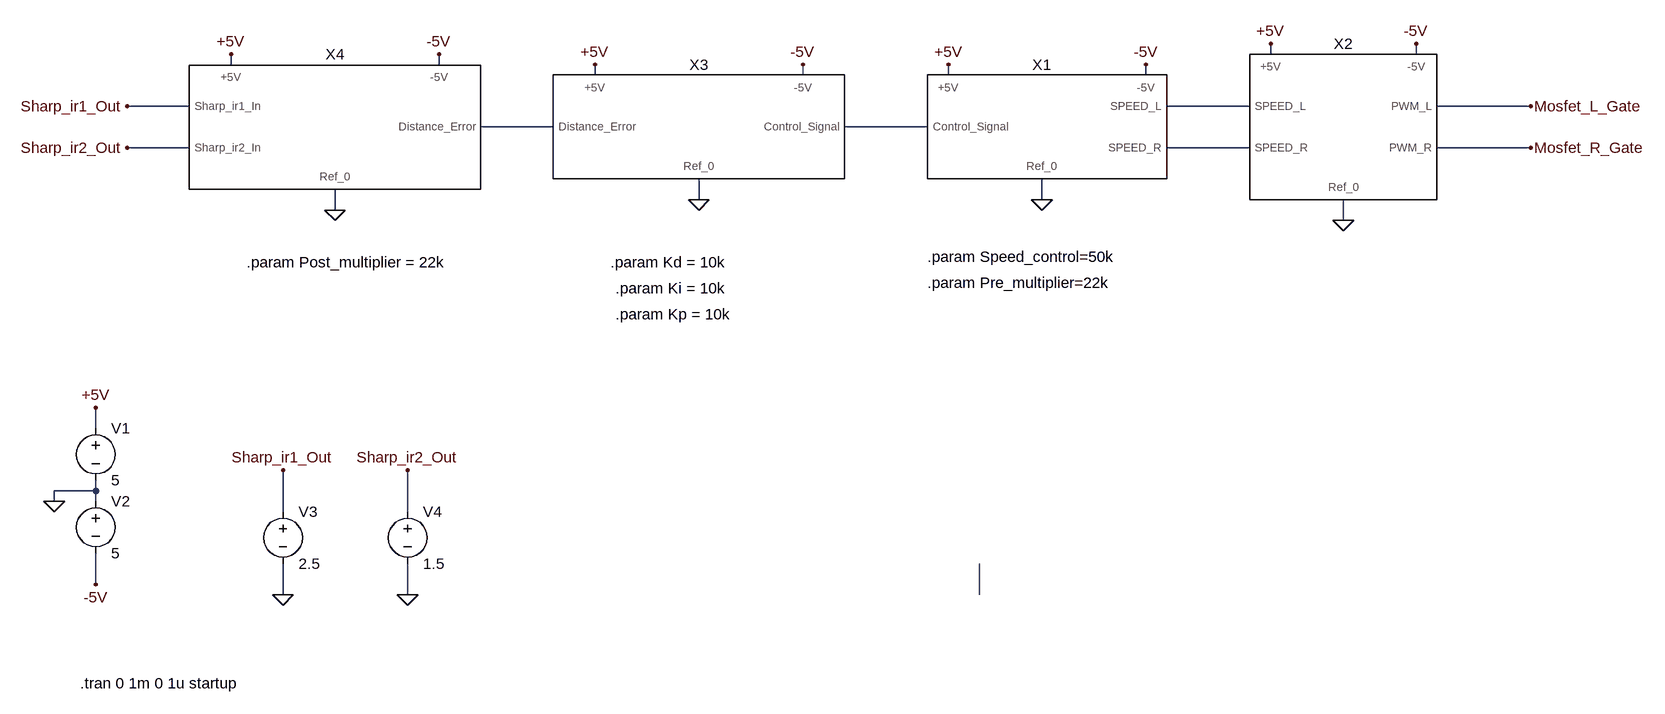
[diagram p0: schematic Full_Circuit.asc]
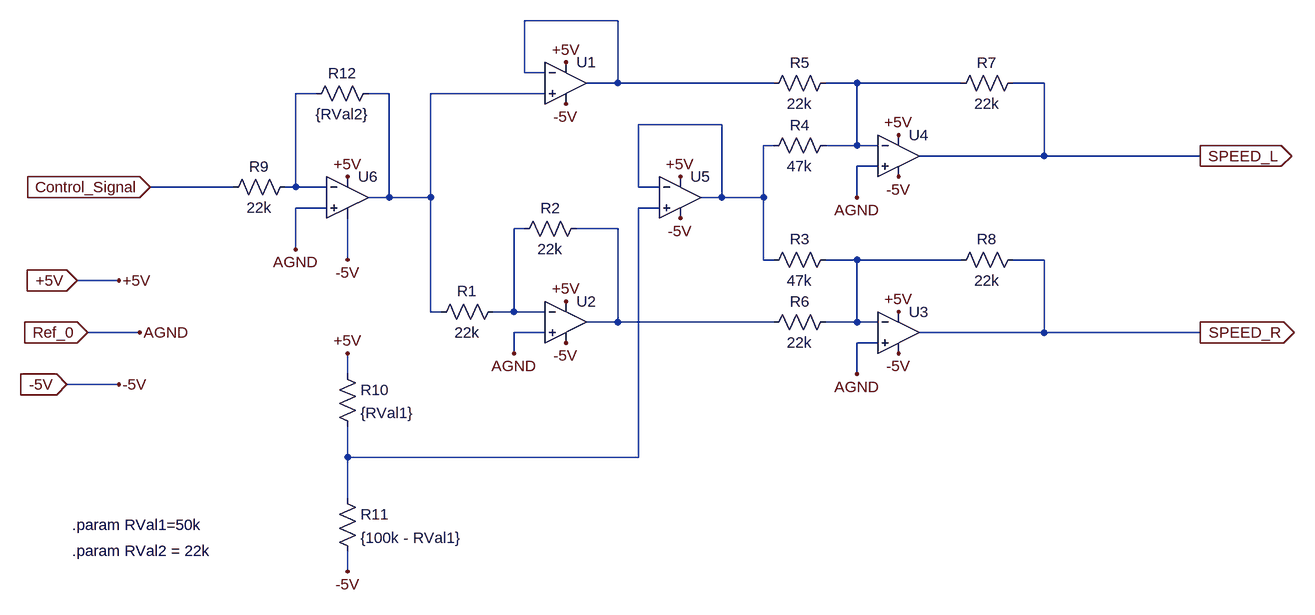
[diagram p1: sub-circuit differential_drive_mixer.asc]
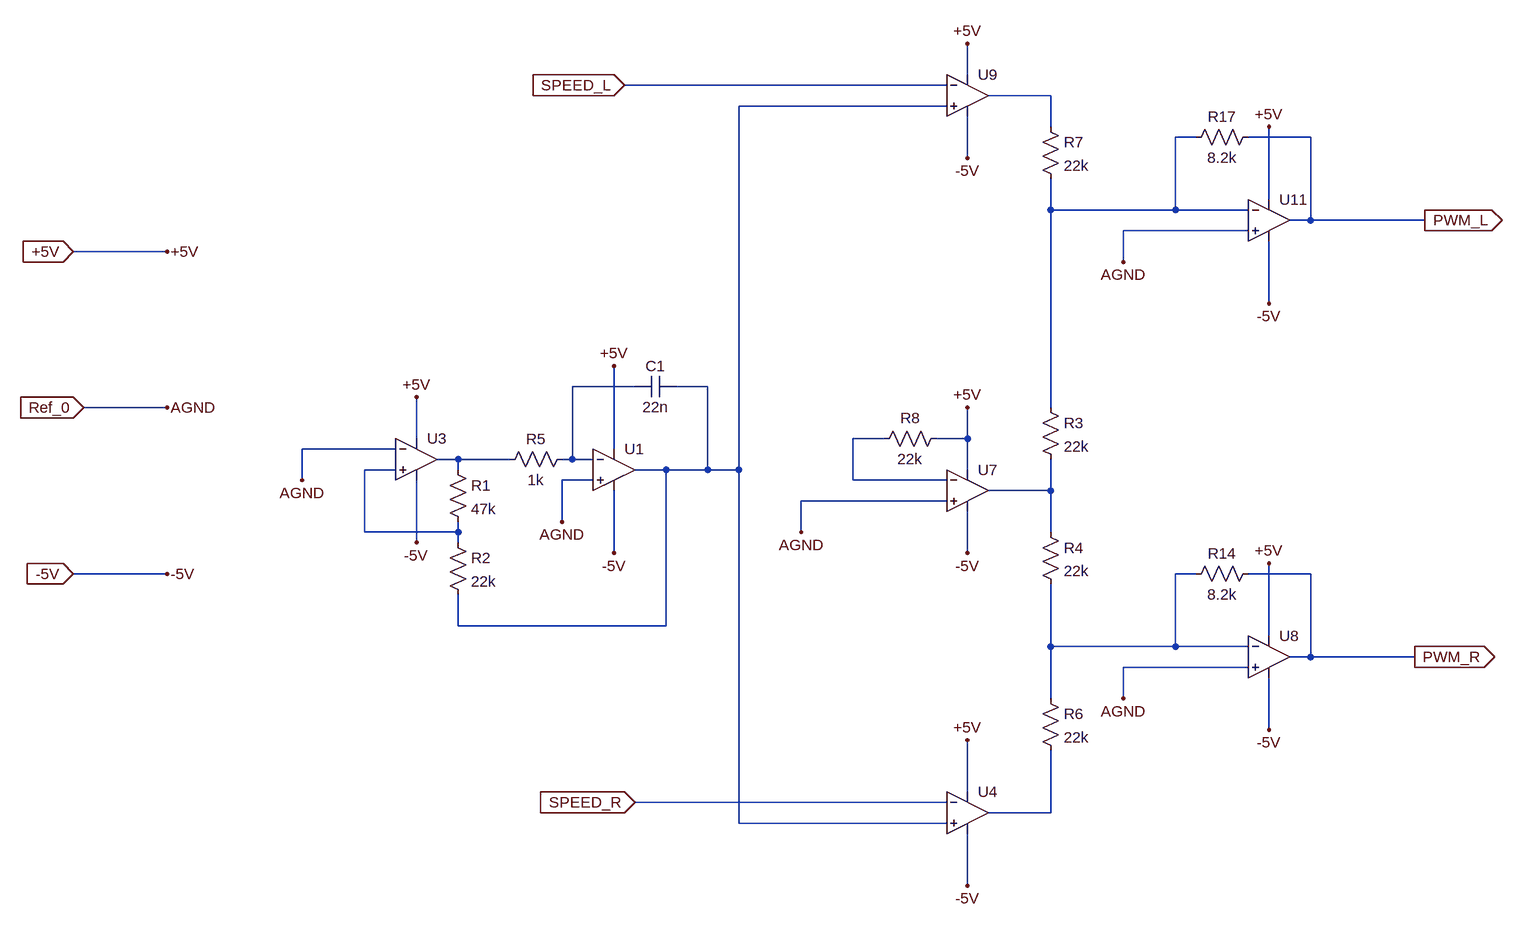
[diagram p2: sub-circuit pwm_generator.asc]
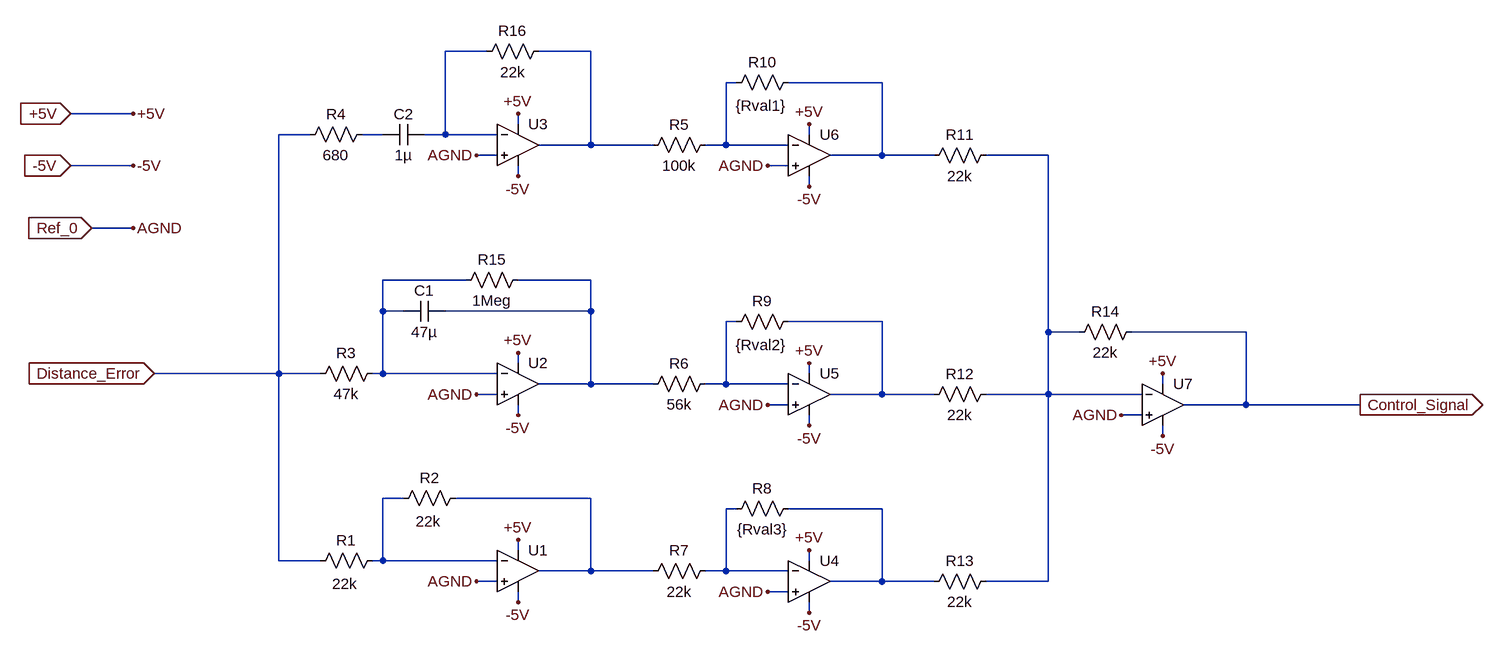
[diagram p3: sub-circuit pid_controller.asc]
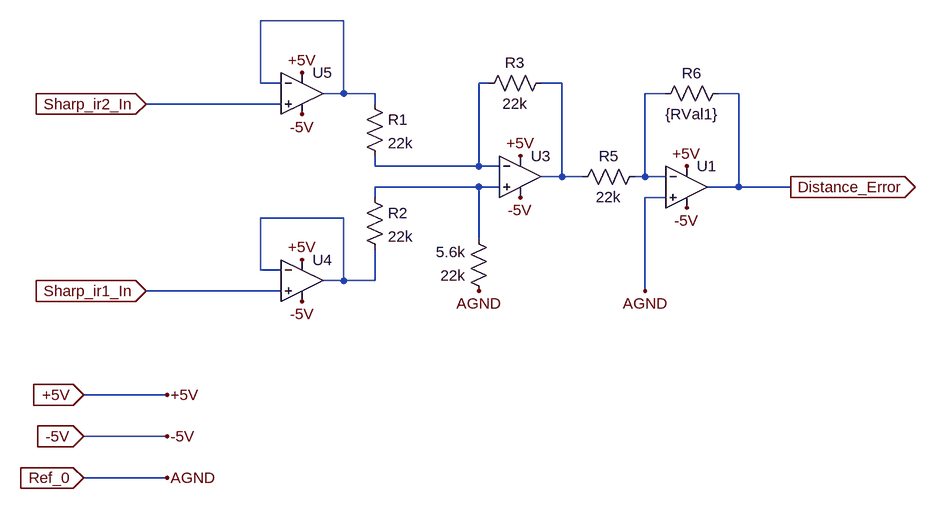
[diagram p4: sub-circuit sensor_interface_sharpir.asc]
Full_Circuit.asc, the LTspice schematic file:
Version 4.1
SHEET 1 1572 1328
WIRE 912 288 912 272
WIRE 1136 288 1136 272
WIRE -688 304 -688 288
WIRE -368 304 -368 288
WIRE -128 320 -128 304
WIRE 192 320 192 304
WIRE 416 320 416 304
WIRE 720 320 720 304
WIRE -752 368 -848 368
WIRE 880 368 752 368
WIRE 1312 368 1168 368
WIRE -192 400 -304 400
WIRE 384 400 256 400
WIRE -752 432 -848 432
WIRE 880 432 752 432
WIRE 1312 432 1168 432
WIRE 32 512 32 480
WIRE 560 512 560 480
WIRE -528 528 -528 496
WIRE 1024 544 1024 512
WIRE -896 864 -896 832
WIRE -896 960 -896 944
WIRE -896 960 -960 960
WIRE -960 976 -960 960
WIRE -896 976 -896 960
WIRE -608 992 -608 928
WIRE -416 992 -416 928
WIRE -896 1104 -896 1056
WIRE -608 1120 -608 1072
WIRE -416 1120 -416 1072
WIRE 464 1120 464 1072
FLAG -896 832 +5V
FLAG -896 1104 -5V
FLAG -960 976 0
FLAG 416 304 +5V
FLAG 720 304 -5V
FLAG 560 512 0
FLAG 912 272 +5V
FLAG 1136 272 -5V
FLAG 1024 544 0
FLAG 32 512 0
FLAG -128 304 +5V
FLAG 192 304 -5V
FLAG -528 528 0
FLAG -688 288 +5V
FLAG -368 288 -5V
FLAG 1312 368 Mosfet_L_Gate
FLAG 1312 432 Mosfet_R_Gate
FLAG -848 368 Sharp_ir1_Out
FLAG -848 432 Sharp_ir2_Out
FLAG -608 1120 0
FLAG -416 1120 0
FLAG -608 928 Sharp_ir1_Out
FLAG -416 928 Sharp_ir2_Out
SYMBOL voltage -896 848 R0
WINDOW 123 0 0 Left 0
WINDOW 39 0 0 Left 0
SYMATTR InstName V1
SYMATTR Value 5
SYMBOL voltage -896 960 R0
WINDOW 123 0 0 Left 0
WINDOW 39 0 0 Left 0
SYMATTR InstName V2
SYMATTR Value 5
SYMBOL Differential_Drive_Mixer 560 400 R0
SYMATTR InstName X1
SYMATTR SpiceLine RVal1 = {Speed_control}  RVal2 = {Pre_Multiplier}
SYMBOL PWM_Generator 1024 400 R0
SYMATTR InstName X2
SYMBOL PID_Controller 32 400 R0
SYMATTR InstName X3
SYMATTR SpiceLine RVal1 = {Kd} RVal2 = {Ki} RVal3 = {Kp}
SYMBOL Sensor_Interface_SharpIR -528 400 R0
SYMATTR InstName X4
SYMATTR SpiceLine RVal1  =  {Post_multiplier}
SYMBOL voltage -608 976 R0
WINDOW 123 0 0 Left 0
WINDOW 39 0 0 Left 0
SYMATTR InstName V3
SYMATTR Value 2.5
SYMBOL voltage -416 976 R0
WINDOW 123 0 0 Left 0
WINDOW 39 0 0 Left 0
SYMATTR InstName V4
SYMATTR Value 1.5
TEXT -920 1256 Left 2 !.tran 0 1m 0 1u startup
TEXT 384 600 Left 2 !.param Speed_control=50k
TEXT 384 640 Left 2 !.param Pre_multiplier=22k
TEXT -104 608 Left 2 !.param Kd = 10k
TEXT -96 648 Left 2 !.param Ki = 10k
TEXT -96 688 Left 2 !.param Kp = 10k
TEXT -664 608 Left 2 !.param Post_multiplier = 22k

differential_drive_mixer.asc, the sub-circuit schematic file:
Version 4.1
SHEET 1 1508 1112
WIRE 80 -32 -64 -32
WIRE -64 48 -64 -32
WIRE -32 48 -64 48
WIRE 80 64 80 -32
WIRE 80 64 32 64
WIRE 320 64 80 64
WIRE 448 64 400 64
WIRE 608 64 448 64
WIRE 736 64 688 64
WIRE -384 80 -416 80
WIRE -272 80 -304 80
WIRE -32 80 -208 80
WIRE 240 128 112 128
WIRE 320 160 304 160
WIRE 448 160 448 64
WIRE 448 160 400 160
WIRE 480 160 448 160
WIRE 736 176 736 64
WIRE 736 176 544 176
WIRE 976 176 736 176
WIRE 480 192 448 192
WIRE -512 224 -640 224
WIRE -416 224 -416 80
WIRE -416 224 -432 224
WIRE -368 224 -416 224
WIRE 112 224 112 128
WIRE 144 224 112 224
WIRE -272 240 -272 80
WIRE -272 240 -304 240
WIRE -208 240 -208 80
WIRE -208 240 -272 240
WIRE 240 240 240 128
WIRE 240 240 208 240
WIRE 304 240 304 160
WIRE 304 240 240 240
WIRE 448 240 448 192
WIRE -368 256 -416 256
WIRE 144 256 112 256
WIRE -64 288 -80 288
WIRE 80 288 16 288
WIRE -416 320 -416 256
WIRE -336 336 -336 272
WIRE 304 336 304 240
WIRE 320 336 304 336
WIRE 448 336 400 336
WIRE 608 336 448 336
WIRE 736 336 688 336
WIRE -688 368 -752 368
WIRE -208 416 -208 240
WIRE -192 416 -208 416
WIRE -80 416 -80 288
WIRE -80 416 -112 416
WIRE -32 416 -80 416
WIRE 80 432 80 288
WIRE 80 432 32 432
WIRE 320 432 80 432
WIRE 448 432 448 336
WIRE 448 432 400 432
WIRE 480 432 448 432
WIRE -656 448 -736 448
WIRE -32 448 -80 448
WIRE 736 448 736 336
WIRE 736 448 544 448
WIRE 976 448 736 448
WIRE 480 464 448 464
WIRE -80 480 -80 448
WIRE -336 512 -336 480
WIRE 448 512 448 464
WIRE -688 528 -768 528
WIRE -336 640 -336 592
WIRE 112 640 112 256
WIRE 112 640 -336 640
WIRE -336 704 -336 640
WIRE -336 816 -336 784
FLAG -640 224 Control_Signal
IOPIN -640 224 In
FLAG -336 208 +5V
FLAG -336 336 -5V
FLAG 0 32 +5V
FLAG 0 96 -5V
FLAG 0 400 +5V
FLAG 512 480 -5V
FLAG 0 464 -5V
FLAG 512 416 +5V
FLAG 512 208 -5V
FLAG 512 144 +5V
FLAG 976 176 SPEED_L
IOPIN 976 176 Out
FLAG 976 448 SPEED_R
IOPIN 976 448 Out
FLAG 176 208 +5V
FLAG 176 272 -5V
FLAG -768 528 -5V
IOPIN -768 528 In
FLAG -688 528 -5V
FLAG -752 368 +5V
IOPIN -752 368 In
FLAG -688 368 +5V
FLAG 448 240 AGND
FLAG 448 512 AGND
FLAG -416 320 AGND
FLAG -80 480 AGND
FLAG -736 448 Ref_0
IOPIN -736 448 In
FLAG -656 448 AGND
FLAG -336 480 +5V
FLAG -336 816 -5V
SYMBOL OpAmps\\UniversalOpAmp2 0 64 R0
SYMATTR InstName U1
SYMATTR Value2 Avol=200k GBW=3Meg Slew=13Meg
SYMATTR SpiceLine Ilimit=25m Rail=1.5 Vos=3m
SYMATTR SpiceLine2 En=18n Enk=100 In=0.01p Ink=10 Rin=1T
SYMBOL OpAmps\\UniversalOpAmp2 0 432 R0
SYMATTR InstName U2
SYMATTR Value2 Avol=200k GBW=3Meg Slew=13Meg
SYMATTR SpiceLine Ilimit=25m Rail=1.5 Vos=3m
SYMATTR SpiceLine2 En=18n Enk=100 In=0.01p Ink=10 Rin=1T
SYMBOL res -96 400 R90
WINDOW 0 0 56 VBottom 2
WINDOW 3 32 56 VTop 2
SYMATTR InstName R1
SYMATTR Value 22k
SYMBOL res 32 272 R90
WINDOW 0 0 56 VBottom 2
WINDOW 3 32 56 VTop 2
SYMATTR InstName R2
SYMATTR Value 22k
SYMBOL res 416 320 R90
WINDOW 0 0 56 VBottom 2
WINDOW 3 32 56 VTop 2
SYMATTR InstName R3
SYMATTR Value 47k
SYMBOL res 416 144 R90
WINDOW 0 0 56 VBottom 2
WINDOW 3 32 56 VTop 2
SYMATTR InstName R4
SYMATTR Value 47k
SYMBOL res 416 48 R90
WINDOW 0 0 56 VBottom 2
WINDOW 3 32 56 VTop 2
SYMATTR InstName R5
SYMATTR Value 22k
SYMBOL res 416 416 R90
WINDOW 0 0 56 VBottom 2
WINDOW 3 32 56 VTop 2
SYMATTR InstName R6
SYMATTR Value 22k
SYMBOL OpAmps\\UniversalOpAmp2 512 448 R0
SYMATTR InstName U3
SYMATTR Value2 Avol=200k GBW=3Meg Slew=13Meg
SYMATTR SpiceLine Ilimit=25m Rail=1.5 Vos=3m
SYMATTR SpiceLine2 En=18n Enk=100 In=0.01p Ink=10 Rin=1T
SYMBOL OpAmps\\UniversalOpAmp2 512 176 R0
SYMATTR InstName U4
SYMATTR Value2 Avol=200k GBW=3Meg Slew=13Meg
SYMATTR SpiceLine Ilimit=25m Rail=1.5 Vos=3m
SYMATTR SpiceLine2 En=18n Enk=100 In=0.01p Ink=10 Rin=1T
SYMBOL res 704 48 R90
WINDOW 0 0 56 VBottom 2
WINDOW 3 32 56 VTop 2
SYMATTR InstName R7
SYMATTR Value 22k
SYMBOL res 704 320 R90
WINDOW 0 0 56 VBottom 2
WINDOW 3 32 56 VTop 2
SYMATTR InstName R8
SYMATTR Value 22k
SYMBOL OpAmps\\UniversalOpAmp2 176 240 R0
SYMATTR InstName U5
SYMATTR Value2 Avol=200k GBW=3Meg Slew=13Meg
SYMATTR SpiceLine Ilimit=25m Rail=1.5 Vos=3m
SYMATTR SpiceLine2 En=18n Enk=100 In=0.01p Ink=10 Rin=1T
SYMBOL OpAmps\\UniversalOpAmp2 -336 240 R0
SYMATTR InstName U6
SYMATTR Value2 Avol=200k GBW=3Meg Slew=13Meg
SYMATTR SpiceLine Ilimit=25m Rail=1.5 Vos=3m
SYMATTR SpiceLine2 En=18n Enk=100 In=0.01p Ink=10 Rin=1T
SYMBOL res -416 208 R90
WINDOW 0 0 56 VBottom 2
WINDOW 3 32 56 VTop 2
SYMATTR InstName R9
SYMATTR Value 22k
SYMBOL res -288 64 R90
WINDOW 0 0 56 VBottom 2
WINDOW 3 32 56 VTop 2
SYMATTR InstName R12
SYMATTR Value {RVal2}
SYMBOL res -352 496 R0
SYMATTR InstName R10
SYMATTR Value {RVal1}
SYMBOL res -352 688 R0
SYMATTR InstName R11
SYMATTR Value {100k - RVal1}
TEXT -760 744 Left 2 !.param RVal1=50k
TEXT -760 784 Left 2 !.param RVal2 = 22k

pwm_generator.asc, the sub-circuit schematic file:
Version 4.1
SHEET 1 3972 1512
WIRE 1744 -656 1744 -704
WIRE 1712 -640 1216 -640
WIRE 1872 -624 1776 -624
WIRE 1712 -608 1392 -608
WIRE 1872 -576 1872 -624
WIRE 2096 -560 2064 -560
WIRE 2272 -560 2176 -560
WIRE 1744 -528 1744 -592
WIRE 2208 -464 2208 -576
WIRE 1872 -448 1872 -496
WIRE 2064 -448 2064 -560
WIRE 2064 -448 1872 -448
WIRE 2176 -448 2064 -448
WIRE 2272 -432 2272 -560
WIRE 2272 -432 2240 -432
WIRE 2448 -432 2272 -432
WIRE 2176 -416 1984 -416
WIRE 512 -384 368 -384
WIRE 1984 -368 1984 -416
WIRE 2208 -304 2208 -400
WIRE 1232 -176 1136 -176
WIRE 1344 -176 1296 -176
WIRE 512 -144 384 -144
WIRE 1872 -144 1872 -448
WIRE 896 -96 896 -160
WIRE 1616 -96 1568 -96
WIRE 1744 -96 1744 -144
WIRE 1744 -96 1696 -96
WIRE 864 -80 720 -80
WIRE 1200 -80 1200 -208
WIRE 960 -64 928 -64
WIRE 1040 -64 960 -64
WIRE 1136 -64 1136 -176
WIRE 1136 -64 1120 -64
WIRE 1168 -64 1136 -64
WIRE 864 -48 816 -48
WIRE 960 -48 960 -64
WIRE 1280 -48 1232 -48
WIRE 1344 -48 1344 -176
WIRE 1344 -48 1280 -48
WIRE 1392 -48 1392 -608
WIRE 1392 -48 1344 -48
WIRE 1744 -48 1744 -96
WIRE 720 -32 720 -80
WIRE 1168 -32 1120 -32
WIRE 1568 -32 1568 -96
WIRE 1712 -32 1568 -32
WIRE 1872 -16 1872 -64
WIRE 1872 -16 1776 -16
WIRE 1712 0 1488 0
WIRE 1120 32 1120 -32
WIRE 816 48 816 -48
WIRE 960 48 960 32
WIRE 960 48 816 48
WIRE 1488 48 1488 0
WIRE 1872 48 1872 -16
WIRE 896 64 896 -32
WIRE 960 64 960 48
WIRE 1200 80 1200 -16
WIRE 1744 80 1744 16
WIRE 512 112 368 112
WIRE 2096 112 2064 112
WIRE 2272 112 2176 112
WIRE 960 192 960 144
WIRE 1280 192 1280 -48
WIRE 1280 192 960 192
WIRE 2208 208 2208 96
WIRE 1872 224 1872 128
WIRE 2064 224 2064 112
WIRE 2064 224 1872 224
WIRE 2176 224 2064 224
WIRE 2272 240 2272 112
WIRE 2272 240 2240 240
WIRE 2432 240 2272 240
WIRE 2176 256 1984 256
WIRE 1872 304 1872 224
WIRE 1984 304 1984 256
WIRE 2208 352 2208 272
WIRE 1744 448 1744 368
WIRE 1712 464 1232 464
WIRE 1872 480 1872 384
WIRE 1872 480 1776 480
WIRE 1392 496 1392 -48
WIRE 1712 496 1392 496
WIRE 1744 592 1744 512
FLAG 2448 -432 PWM_L
IOPIN 2448 -432 Out
FLAG 2432 240 PWM_R
IOPIN 2432 240 Out
FLAG 1216 -640 SPEED_L
IOPIN 1216 -640 In
FLAG 1232 464 SPEED_R
IOPIN 1232 464 In
FLAG 1744 -144 +5V
FLAG 1744 80 -5V
FLAG 1744 -528 -5V
FLAG 1744 -704 +5V
FLAG 1744 368 +5V
FLAG 1744 592 -5V
FLAG 2208 -576 +5V
FLAG 2208 -304 -5V
FLAG 2208 96 +5V
FLAG 2208 352 -5V
FLAG 1200 80 -5V
FLAG 1200 -208 +5V
FLAG 896 -160 +5V
FLAG 896 64 -5V
FLAG 368 -384 +5V
IOPIN 368 -384 In
FLAG 368 112 -5V
IOPIN 368 112 In
FLAG 512 -384 +5V
FLAG 512 112 -5V
FLAG 1120 32 AGND
FLAG 720 -32 AGND
FLAG 1488 48 AGND
FLAG 1984 304 AGND
FLAG 1984 -368 AGND
FLAG 384 -144 Ref_0
IOPIN 384 -144 In
FLAG 512 -144 AGND
SYMBOL OpAmps\\UniversalOpAmp2 896 -64 R0
SYMATTR InstName U3
SYMATTR Value2 Avol=200k GBW=3Meg Slew=13Meg
SYMATTR SpiceLine Ilimit=25m Rail=1.5 Vos=3m
SYMATTR SpiceLine2 En=18n Enk=100 In=0.01p Ink=10 Rin=1T
SYMBOL OpAmps\\UniversalOpAmp2 1200 -48 R0
SYMATTR InstName U1
SYMATTR Value2 Avol=200k GBW=3Meg Slew=13Meg
SYMATTR SpiceLine Ilimit=25m Rail=1.5 Vos=3m
SYMATTR SpiceLine2 En=18n Enk=100 In=0.01p Ink=10 Rin=1T
SYMBOL res 1136 -80 R90
WINDOW 0 0 56 VBottom 2
WINDOW 3 32 56 VTop 2
SYMATTR InstName R5
SYMATTR Value 1k
SYMBOL cap 1296 -192 R90
WINDOW 0 0 32 VBottom 2
WINDOW 3 32 32 VTop 2
SYMATTR InstName C1
SYMATTR Value 22n
SYMBOL res 944 -64 R0
SYMATTR InstName R1
SYMATTR Value 47k
SYMBOL res 944 48 R0
SYMATTR InstName R2
SYMATTR Value 22k
SYMBOL OpAmps\\UniversalOpAmp2 1744 480 R0
SYMATTR InstName U4
SYMATTR Value2 Avol=200k GBW=3Meg Slew=13Meg
SYMATTR SpiceLine Ilimit=25m Rail=1.5 Vos=3m
SYMATTR SpiceLine2 En=18n Enk=100 In=0.01p Ink=10 Rin=1T
SYMBOL OpAmps\\UniversalOpAmp2 1744 -16 R0
SYMATTR InstName U7
SYMATTR Value2 Avol=200k GBW=3Meg Slew=13Meg
SYMATTR SpiceLine Ilimit=25m Rail=1.5 Vos=3m
SYMATTR SpiceLine2 En=18n Enk=100 In=0.01p Ink=10 Rin=1T
SYMBOL OpAmps\\UniversalOpAmp2 2208 240 R0
SYMATTR InstName U8
SYMATTR Value2 Avol=200k GBW=3Meg Slew=13Meg
SYMATTR SpiceLine Ilimit=25m Rail=1.5 Vos=3m
SYMATTR SpiceLine2 En=18n Enk=100 In=0.01p Ink=10 Rin=1T
SYMBOL res 2192 96 R90
WINDOW 0 0 56 VBottom 2
WINDOW 3 32 56 VTop 2
SYMATTR InstName R14
SYMATTR Value 8.2k
SYMBOL OpAmps\\UniversalOpAmp2 1744 -624 R0
SYMATTR InstName U9
SYMATTR Value2 Avol=200k GBW=3Meg Slew=13Meg
SYMATTR SpiceLine Ilimit=25m Rail=1.5 Vos=3m
SYMATTR SpiceLine2 En=18n Enk=100 In=0.01p Ink=10 Rin=1T
SYMBOL OpAmps\\UniversalOpAmp2 2208 -432 R0
SYMATTR InstName U11
SYMATTR Value2 Avol=200k GBW=3Meg Slew=13Meg
SYMATTR SpiceLine Ilimit=25m Rail=1.5 Vos=3m
SYMATTR SpiceLine2 En=18n Enk=100 In=0.01p Ink=10 Rin=1T
SYMBOL res 2192 -576 R90
WINDOW 0 0 56 VBottom 2
WINDOW 3 32 56 VTop 2
SYMATTR InstName R17
SYMATTR Value 8.2k
SYMBOL res 1856 -160 R0
SYMATTR InstName R3
SYMATTR Value 22k
SYMBOL res 1856 32 R0
SYMATTR InstName R4
SYMATTR Value 22k
SYMBOL res 1856 288 R0
SYMATTR InstName R6
SYMATTR Value 22k
SYMBOL res 1856 -592 R0
SYMATTR InstName R7
SYMATTR Value 22k
SYMBOL res 1712 -112 R90
WINDOW 0 0 56 VBottom 2
WINDOW 3 32 56 VTop 2
SYMATTR InstName R8
SYMATTR Value 22k

pid_controller.asc, the sub-circuit schematic file:
Version 4.1
SHEET 1 1656 680
WIRE 80 -640 16 -640
WIRE 240 -640 160 -640
WIRE 464 -592 448 -592
WIRE 688 -592 544 -592
WIRE -464 -544 -560 -544
WIRE 128 -528 128 -544
WIRE -192 -512 -240 -512
WIRE -80 -512 -112 -512
WIRE 16 -512 16 -640
WIRE 16 -512 -16 -512
WIRE 96 -512 16 -512
WIRE 576 -512 576 -528
WIRE 240 -496 240 -640
WIRE 240 -496 160 -496
WIRE 336 -496 240 -496
WIRE 448 -496 448 -592
WIRE 448 -496 416 -496
WIRE 544 -496 448 -496
WIRE 96 -480 64 -480
WIRE 688 -480 688 -592
WIRE 688 -480 608 -480
WIRE 768 -480 688 -480
WIRE 944 -480 848 -480
WIRE -464 -464 -560 -464
WIRE 544 -464 512 -464
WIRE 128 -448 128 -464
WIRE 576 -432 576 -448
WIRE -464 -368 -528 -368
WIRE 48 -288 -80 -288
WIRE 240 -288 128 -288
WIRE -80 -240 -80 -288
WIRE -48 -240 -80 -240
WIRE 240 -240 240 -288
WIRE 240 -240 16 -240
WIRE 464 -224 448 -224
WIRE 688 -224 544 -224
WIRE 944 -208 944 -480
WIRE 992 -208 944 -208
WIRE 1248 -208 1072 -208
WIRE 128 -160 128 -176
WIRE -240 -144 -240 -512
WIRE -240 -144 -432 -144
WIRE -176 -144 -240 -144
WIRE -80 -144 -80 -240
WIRE -80 -144 -96 -144
WIRE 96 -144 -80 -144
WIRE 576 -144 576 -160
WIRE 240 -128 240 -240
WIRE 240 -128 160 -128
WIRE 336 -128 240 -128
WIRE 448 -128 448 -224
WIRE 448 -128 416 -128
WIRE 544 -128 448 -128
WIRE 1120 -128 1120 -144
WIRE 96 -112 64 -112
WIRE 688 -112 688 -224
WIRE 688 -112 608 -112
WIRE 768 -112 688 -112
WIRE 944 -112 944 -208
WIRE 944 -112 848 -112
WIRE 1088 -112 944 -112
WIRE 544 -96 512 -96
WIRE 1248 -96 1248 -208
WIRE 1248 -96 1152 -96
WIRE 1424 -96 1248 -96
WIRE 128 -80 128 -96
WIRE 1088 -80 1056 -80
WIRE 576 -64 576 -80
WIRE 1120 -48 1120 -64
WIRE -48 48 -80 48
WIRE 240 48 32 48
WIRE 464 64 448 64
WIRE 688 64 544 64
WIRE 128 128 128 112
WIRE -240 144 -240 -144
WIRE -176 144 -240 144
WIRE -80 144 -80 48
WIRE -80 144 -96 144
WIRE 96 144 -80 144
WIRE 576 144 576 128
WIRE 240 160 240 48
WIRE 240 160 160 160
WIRE 336 160 240 160
WIRE 448 160 448 64
WIRE 448 160 416 160
WIRE 544 160 448 160
WIRE 96 176 64 176
WIRE 688 176 688 64
WIRE 688 176 608 176
WIRE 768 176 688 176
WIRE 944 176 944 -112
WIRE 944 176 848 176
WIRE 544 192 512 192
WIRE 128 208 128 192
WIRE 576 224 576 208
FLAG -432 -144 Distance_Error
IOPIN -432 -144 In
FLAG 1424 -96 Control_Signal
IOPIN 1424 -96 Out
FLAG 128 -544 +5V
FLAG 576 -528 +5V
FLAG 128 -176 +5V
FLAG 576 -160 +5V
FLAG 576 128 +5V
FLAG 128 112 +5V
FLAG 1120 -144 +5V
FLAG 128 -448 -5V
FLAG 128 -80 -5V
FLAG 128 208 -5V
FLAG 576 224 -5V
FLAG 576 -64 -5V
FLAG 576 -432 -5V
FLAG 1120 -48 -5V
FLAG 1056 -80 AGND
FLAG 64 -112 AGND
FLAG 64 176 AGND
FLAG 512 192 AGND
FLAG 512 -96 AGND
FLAG 512 -464 AGND
FLAG 64 -480 AGND
FLAG -560 -544 +5V
IOPIN -560 -544 In
FLAG -560 -464 -5V
IOPIN -560 -464 In
FLAG -528 -368 Ref_0
IOPIN -528 -368 In
FLAG -464 -544 +5V
FLAG -464 -464 -5V
FLAG -464 -368 AGND
SYMBOL OpAmps\\UniversalOpAmp2 128 160 R0
SYMATTR InstName U1
SYMATTR Value2 Avol=200k GBW=3Meg Slew=13Meg
SYMATTR SpiceLine Ilimit=25m Rail=1.5 Vos=3m
SYMATTR SpiceLine2 En=18n Enk=100 In=0.01p Ink=10 Rin=1T
SYMBOL res -80 128 R90
WINDOW 0 0 56 VBottom 2
WINDOW 3 36 58 VTop 2
SYMATTR InstName R1
SYMATTR Value 22k
SYMBOL res 48 32 R90
WINDOW 0 0 56 VBottom 2
WINDOW 3 36 58 VTop 2
SYMATTR InstName R2
SYMATTR Value 22k
SYMBOL OpAmps\\UniversalOpAmp2 128 -128 R0
SYMATTR InstName U2
SYMATTR Value2 Avol=200k GBW=3Meg Slew=13Meg
SYMATTR SpiceLine Ilimit=25m Rail=1.5 Vos=3m
SYMATTR SpiceLine2 En=18n Enk=100 In=0.01p Ink=10 Rin=1T
SYMBOL res -80 -160 R90
WINDOW 0 0 56 VBottom 2
WINDOW 3 32 56 VTop 2
SYMATTR InstName R3
SYMATTR Value 47k
SYMBOL cap 16 -256 R90
WINDOW 0 0 32 VBottom 2
WINDOW 3 32 32 VTop 2
SYMATTR InstName C1
SYMATTR Value 47µ
SYMBOL OpAmps\\UniversalOpAmp2 128 -496 R0
SYMATTR InstName U3
SYMATTR Value2 Avol=200k GBW=3Meg Slew=13Meg
SYMATTR SpiceLine Ilimit=25m Rail=1.5 Vos=3m
SYMATTR SpiceLine2 En=18n Enk=100 In=0.01p Ink=10 Rin=1T
SYMBOL cap -16 -528 R90
WINDOW 0 0 32 VBottom 2
WINDOW 3 32 32 VTop 2
SYMATTR InstName C2
SYMATTR Value 1µ
SYMBOL OpAmps\\UniversalOpAmp2 576 176 R0
SYMATTR InstName U4
SYMATTR Value2 Avol=200k GBW=3Meg Slew=13Meg
SYMATTR SpiceLine Ilimit=25m Rail=1.5 Vos=3m
SYMATTR SpiceLine2 En=18n Enk=100 In=0.01p Ink=10 Rin=1T
SYMBOL OpAmps\\UniversalOpAmp2 576 -112 R0
SYMATTR InstName U5
SYMATTR Value2 Avol=200k GBW=3Meg Slew=13Meg
SYMATTR SpiceLine Ilimit=25m Rail=1.5 Vos=3m
SYMATTR SpiceLine2 En=18n Enk=100 In=0.01p Ink=10 Rin=1T
SYMBOL OpAmps\\UniversalOpAmp2 576 -480 R0
SYMATTR InstName U6
SYMATTR Value2 Avol=200k GBW=3Meg Slew=13Meg
SYMATTR SpiceLine Ilimit=25m Rail=1.5 Vos=3m
SYMATTR SpiceLine2 En=18n Enk=100 In=0.01p Ink=10 Rin=1T
SYMBOL res 432 -512 R90
WINDOW 0 0 56 VBottom 2
WINDOW 3 32 56 VTop 2
SYMATTR InstName R5
SYMATTR Value 100k
SYMBOL res 432 -144 R90
WINDOW 0 0 56 VBottom 2
WINDOW 3 32 56 VTop 2
SYMATTR InstName R6
SYMATTR Value 56k
SYMBOL res 560 48 R90
WINDOW 0 0 56 VBottom 2
WINDOW 3 32 56 VTop 2
SYMATTR InstName R8
SYMATTR Value {Rval3}
SYMBOL res 560 -240 R90
WINDOW 0 0 56 VBottom 2
WINDOW 3 36 58 VTop 2
SYMATTR InstName R9
SYMATTR Value {Rval2}
SYMBOL res 560 -608 R90
WINDOW 0 0 56 VBottom 2
WINDOW 3 36 58 VTop 2
SYMATTR InstName R10
SYMATTR Value {Rval1}
SYMBOL res 864 -496 R90
WINDOW 0 0 56 VBottom 2
WINDOW 3 32 56 VTop 2
SYMATTR InstName R11
SYMATTR Value 22k
SYMBOL res 864 -128 R90
WINDOW 0 0 56 VBottom 2
WINDOW 3 32 56 VTop 2
SYMATTR InstName R12
SYMATTR Value 22k
SYMBOL res 864 160 R90
WINDOW 0 0 56 VBottom 2
WINDOW 3 32 56 VTop 2
SYMATTR InstName R13
SYMATTR Value 22k
SYMBOL OpAmps\\UniversalOpAmp2 1120 -96 R0
SYMATTR InstName U7
SYMATTR Value2 Avol=200k GBW=3Meg Slew=13Meg
SYMATTR SpiceLine Ilimit=25m Rail=1.5 Vos=3m
SYMATTR SpiceLine2 En=18n Enk=100 In=0.01p Ink=10 Rin=1T
SYMBOL res 1088 -224 R90
WINDOW 0 0 56 VBottom 2
WINDOW 3 32 56 VTop 2
SYMATTR InstName R14
SYMATTR Value 22k
SYMBOL res 432 144 R90
WINDOW 0 0 56 VBottom 2
WINDOW 3 32 56 VTop 2
SYMATTR InstName R7
SYMATTR Value 22k
SYMBOL res 144 -304 R90
WINDOW 0 0 56 VBottom 2
WINDOW 3 32 56 VTop 2
SYMATTR InstName R15
SYMATTR Value 1Meg
SYMBOL res -96 -528 R90
WINDOW 0 0 56 VBottom 2
WINDOW 3 32 56 VTop 2
SYMATTR InstName R4
SYMATTR Value 680
SYMBOL res 176 -656 R90
WINDOW 0 0 56 VBottom 2
WINDOW 3 32 56 VTop 2
SYMATTR InstName R16
SYMATTR Value 22k

sensor_interface_sharpir.asc, the sub-circuit schematic file:
Version 4.1
SHEET 1 880 680
WIRE -80 -240 -208 -240
WIRE -208 -144 -208 -240
WIRE -176 -144 -208 -144
WIRE 144 -144 128 -144
WIRE 256 -144 224 -144
WIRE -80 -128 -80 -240
WIRE -80 -128 -112 -128
WIRE -32 -128 -80 -128
WIRE 416 -128 384 -128
WIRE 528 -128 496 -128
WIRE -176 -112 -384 -112
WIRE -32 -112 -32 -128
WIRE -32 -16 -32 -32
WIRE 128 -16 128 -144
WIRE 128 -16 -32 -16
WIRE 160 -16 128 -16
WIRE 256 0 256 -144
WIRE 256 0 224 0
WIRE 288 0 256 0
WIRE 384 0 384 -128
WIRE 384 0 368 0
WIRE 416 0 384 0
WIRE 128 16 -32 16
WIRE 160 16 128 16
WIRE 528 16 528 -128
WIRE 528 16 480 16
WIRE 608 16 528 16
WIRE -32 32 -32 16
WIRE 416 32 384 32
WIRE -80 64 -208 64
WIRE 128 96 128 16
WIRE -208 144 -208 64
WIRE -176 144 -208 144
WIRE -80 160 -80 64
WIRE -80 160 -112 160
WIRE -32 160 -32 112
WIRE -32 160 -80 160
WIRE -176 176 -384 176
WIRE 384 176 384 32
WIRE -352 336 -480 336
WIRE -352 400 -480 400
WIRE -352 464 -480 464
FLAG -384 176 Sharp_ir1_In
IOPIN -384 176 In
FLAG -384 -112 Sharp_ir2_In
IOPIN -384 -112 In
FLAG 608 16 Distance_Error
IOPIN 608 16 Out
FLAG 192 -32 +5V
FLAG 448 -16 +5V
FLAG 192 32 -5V
FLAG 448 48 -5V
FLAG -144 128 +5V
FLAG -144 192 -5V
FLAG -144 -160 +5V
FLAG -144 -96 -5V
FLAG 128 176 AGND
FLAG 384 176 AGND
FLAG -480 336 +5V
IOPIN -480 336 In
FLAG -480 400 -5V
IOPIN -480 400 In
FLAG -480 464 Ref_0
IOPIN -480 464 In
FLAG -352 336 +5V
FLAG -352 400 -5V
FLAG -352 464 AGND
SYMBOL OpAmps\\UniversalOpAmp2 192 0 R0
SYMATTR InstName U3
SYMATTR Value2 Avol=200k GBW=3Meg Slew=13Meg
SYMATTR SpiceLine Ilimit=25m Rail=1.5 Vos=3m
SYMATTR SpiceLine2 En=18n Enk=100 In=0.01p Ink=10 Rin=1T
SYMBOL OpAmps\\UniversalOpAmp2 -144 160 R0
SYMATTR InstName U4
SYMATTR Value2 Avol=200k GBW=3Meg Slew=13Meg
SYMATTR SpiceLine Ilimit=25m Rail=1.5 Vos=3m
SYMATTR SpiceLine2 En=18n Enk=100 In=0.01p Ink=10 Rin=1T
SYMBOL OpAmps\\UniversalOpAmp2 -144 -128 R0
SYMATTR InstName U5
SYMATTR Value2 Avol=200k GBW=3Meg Slew=13Meg
SYMATTR SpiceLine Ilimit=25m Rail=1.5 Vos=3m
SYMATTR SpiceLine2 En=18n Enk=100 In=0.01p Ink=10 Rin=1T
SYMBOL res -48 -128 R0
SYMATTR InstName R1
SYMATTR Value 22k
SYMBOL res -48 16 R0
SYMATTR InstName R2
SYMATTR Value 22k
SYMBOL res 240 -160 R90
WINDOW 0 0 56 VBottom 2
WINDOW 3 32 56 VTop 2
SYMATTR InstName R3
SYMATTR Value 22k
SYMBOL res 144 192 R180
WINDOW 0 36 76 Left 2
WINDOW 3 36 40 Left 2
SYMATTR InstName 5.6k
SYMATTR Value 22k
SYMBOL OpAmps\\UniversalOpAmp2 448 16 R0
SYMATTR InstName U1
SYMATTR Value2 Avol=200k GBW=3Meg Slew=13Meg
SYMATTR SpiceLine Ilimit=25m Rail=1.5 Vos=3m
SYMATTR SpiceLine2 En=18n Enk=100 In=0.01p Ink=10 Rin=1T
SYMBOL res 384 -16 R90
WINDOW 0 0 56 VBottom 2
WINDOW 3 32 56 VTop 2
SYMATTR InstName R5
SYMATTR Value 22k
SYMBOL res 512 -144 R90
WINDOW 0 0 56 VBottom 2
WINDOW 3 32 56 VTop 2
SYMATTR InstName R6
SYMATTR Value {RVal1}

The netlist it stands for:
* Full_Circuit.asc
V1 +5V 0 5
V2 0 -5V 5
X§X1 +5V -5V N003 0 N001 N004 differential_drive_mixer params: RVal1 = {Speed_control}  RVal2 = {Pre_Multiplier}
X§X2 +5V -5V 0 N001 N004 Mosfet_L_Gate Mosfet_R_Gate pwm_generator
X§X3 +5V -5V N002 0 N003 pid_controller params: RVal1 = {Kd} RVal2 = {Ki} RVal3 = {Kp}
X§X4 +5V -5V 0 Sharp_ir1_Out Sharp_ir2_Out N002 sensor_interface_sharpir params: RVal1  =  {Post_multiplier}
V3 Sharp_ir1_Out 0 2.5
V4 Sharp_ir2_Out 0 1.5

* block symbol definitions
.subckt differential_drive_mixer +5V -5V Control_Signal Ref_0 SPEED_L SPEED_R
X§U1 N004 N001 +5V -5V N001 level2 Avol=200k GBW=3Meg Slew=13Meg Ilimit=25m Rail=1.5 Vos=3m En=18n Enk=100 In=0.01p Ink=10 Rin=1T  ; pins In+ In- V+ V- OUT
X§U2 Ref_0 N007 +5V -5V N008 level2 Avol=200k GBW=3Meg Slew=13Meg Ilimit=25m Rail=1.5 Vos=3m En=18n Enk=100 In=0.01p Ink=10 Rin=1T  ; pins In+ In- V+ V- OUT
R1 N007 N004 22k
R2 N008 N007 22k
R3 N009 N005 47k
R4 N002 N005 47k
R5 N002 N001 22k
R6 N009 N008 22k
X§U3 Ref_0 N009 +5V -5V SPEED_R level2 Avol=200k GBW=3Meg Slew=13Meg Ilimit=25m Rail=1.5 Vos=3m En=18n Enk=100 In=0.01p Ink=10 Rin=1T  ; pins In+ In- V+ V- OUT
X§U4 Ref_0 N002 +5V -5V SPEED_L level2 Avol=200k GBW=3Meg Slew=13Meg Ilimit=25m Rail=1.5 Vos=3m En=18n Enk=100 In=0.01p Ink=10 Rin=1T  ; pins In+ In- V+ V- OUT
R7 SPEED_L N002 22k
R8 SPEED_R N009 22k
X§U5 N006 N005 +5V -5V N005 level2 Avol=200k GBW=3Meg Slew=13Meg Ilimit=25m Rail=1.5 Vos=3m En=18n Enk=100 In=0.01p Ink=10 Rin=1T  ; pins In+ In- V+ V- OUT
X§U6 Ref_0 N003 +5V -5V N004 level2 Avol=200k GBW=3Meg Slew=13Meg Ilimit=25m Rail=1.5 Vos=3m En=18n Enk=100 In=0.01p Ink=10 Rin=1T  ; pins In+ In- V+ V- OUT
R9 N003 Control_Signal 22k
R12 N004 N003 {RVal2}
R10 +5V N006 {RVal1}
R11 N006 -5V {100k - RVal1}
.param RVal1=50k
.param RVal2 = 22k
.ends differential_drive_mixer

.subckt pwm_generator +5V -5V Ref_0 SPEED_L SPEED_R PWM_L PWM_R
X§U3 N007 Ref_0 +5V -5V N006 level2 Avol=200k GBW=3Meg Slew=13Meg Ilimit=25m Rail=1.5 Vos=3m En=18n Enk=100 In=0.01p Ink=10 Rin=1T  ; pins In+ In- V+ V- OUT
X§U1 Ref_0 N004 +5V -5V N002 level2 Avol=200k GBW=3Meg Slew=13Meg Ilimit=25m Rail=1.5 Vos=3m En=18n Enk=100 In=0.01p Ink=10 Rin=1T  ; pins In+ In- V+ V- OUT
R5 N004 N006 1k
C1 N002 N004 22n
R1 N006 N007 47k
R2 N007 N002 22k
X§U4 N002 SPEED_R +5V -5V N010 level2 Avol=200k GBW=3Meg Slew=13Meg Ilimit=25m Rail=1.5 Vos=3m En=18n Enk=100 In=0.01p Ink=10 Rin=1T  ; pins In+ In- V+ V- OUT
X§U7 Ref_0 N005 +5V -5V N008 level2 Avol=200k GBW=3Meg Slew=13Meg Ilimit=25m Rail=1.5 Vos=3m En=18n Enk=100 In=0.01p Ink=10 Rin=1T  ; pins In+ In- V+ V- OUT
X§U8 Ref_0 N009 +5V -5V PWM_R level2 Avol=200k GBW=3Meg Slew=13Meg Ilimit=25m Rail=1.5 Vos=3m En=18n Enk=100 In=0.01p Ink=10 Rin=1T  ; pins In+ In- V+ V- OUT
R14 PWM_R N009 8.2k
X§U9 N002 SPEED_L +5V -5V N001 level2 Avol=200k GBW=3Meg Slew=13Meg Ilimit=25m Rail=1.5 Vos=3m En=18n Enk=100 In=0.01p Ink=10 Rin=1T  ; pins In+ In- V+ V- OUT
X§U11 Ref_0 N003 +5V -5V PWM_L level2 Avol=200k GBW=3Meg Slew=13Meg Ilimit=25m Rail=1.5 Vos=3m En=18n Enk=100 In=0.01p Ink=10 Rin=1T  ; pins In+ In- V+ V- OUT
R17 PWM_L N003 8.2k
R3 N003 N008 22k
R4 N008 N009 22k
R6 N009 N010 22k
R7 N001 N003 22k
R8 +5V N005 22k
.ends pwm_generator

.subckt pid_controller +5V -5V Distance_Error Ref_0 Control_Signal
X§U1 Ref_0 N011 +5V -5V N012 level2 Avol=200k GBW=3Meg Slew=13Meg Ilimit=25m Rail=1.5 Vos=3m En=18n Enk=100 In=0.01p Ink=10 Rin=1T  ; pins In+ In- V+ V- OUT
R1 N011 Distance_Error 22k
R2 N012 N011 22k
X§U2 Ref_0 N007 +5V -5V N008 level2 Avol=200k GBW=3Meg Slew=13Meg Ilimit=25m Rail=1.5 Vos=3m En=18n Enk=100 In=0.01p Ink=10 Rin=1T  ; pins In+ In- V+ V- OUT
R3 N007 Distance_Error 47k
C1 N008 N007 47µ
X§U3 Ref_0 N001 +5V -5V N002 level2 Avol=200k GBW=3Meg Slew=13Meg Ilimit=25m Rail=1.5 Vos=3m En=18n Enk=100 In=0.01p Ink=10 Rin=1T  ; pins In+ In- V+ V- OUT
C2 N001 N005 1µ
X§U4 Ref_0 N013 +5V -5V N014 level2 Avol=200k GBW=3Meg Slew=13Meg Ilimit=25m Rail=1.5 Vos=3m En=18n Enk=100 In=0.01p Ink=10 Rin=1T  ; pins In+ In- V+ V- OUT
X§U5 Ref_0 N009 +5V -5V N010 level2 Avol=200k GBW=3Meg Slew=13Meg Ilimit=25m Rail=1.5 Vos=3m En=18n Enk=100 In=0.01p Ink=10 Rin=1T  ; pins In+ In- V+ V- OUT
X§U6 Ref_0 N003 +5V -5V N004 level2 Avol=200k GBW=3Meg Slew=13Meg Ilimit=25m Rail=1.5 Vos=3m En=18n Enk=100 In=0.01p Ink=10 Rin=1T  ; pins In+ In- V+ V- OUT
R5 N003 N002 100k
R6 N009 N008 56k
R8 N014 N013 {Rval3}
R9 N010 N009 {Rval2}
R10 N004 N003 {Rval1}
R11 N006 N004 22k
R12 N006 N010 22k
R13 N006 N014 22k
X§U7 Ref_0 N006 +5V -5V Control_Signal level2 Avol=200k GBW=3Meg Slew=13Meg Ilimit=25m Rail=1.5 Vos=3m En=18n Enk=100 In=0.01p Ink=10 Rin=1T  ; pins In+ In- V+ V- OUT
R14 Control_Signal N006 22k
R7 N013 N012 22k
R15 N008 N007 1Meg
R4 N005 Distance_Error 680
R16 N002 N001 22k
.ends pid_controller

.subckt sensor_interface_sharpir +5V -5V Ref_0 Sharp_ir1_In Sharp_ir2_In Distance_Error
X§U3 N005 N002 +5V -5V N003 level2 Avol=200k GBW=3Meg Slew=13Meg Ilimit=25m Rail=1.5 Vos=3m En=18n Enk=100 In=0.01p Ink=10 Rin=1T  ; pins In+ In- V+ V- OUT
X§U4 Sharp_ir1_In N006 +5V -5V N006 level2 Avol=200k GBW=3Meg Slew=13Meg Ilimit=25m Rail=1.5 Vos=3m En=18n Enk=100 In=0.01p Ink=10 Rin=1T  ; pins In+ In- V+ V- OUT
X§U5 Sharp_ir2_In N001 +5V -5V N001 level2 Avol=200k GBW=3Meg Slew=13Meg Ilimit=25m Rail=1.5 Vos=3m En=18n Enk=100 In=0.01p Ink=10 Rin=1T  ; pins In+ In- V+ V- OUT
R1 N001 N002 22k
R2 N005 N006 22k
R3 N003 N002 22k
R§5.6k Ref_0 N005 22k
X§U1 Ref_0 N004 +5V -5V Distance_Error level2 Avol=200k GBW=3Meg Slew=13Meg Ilimit=25m Rail=1.5 Vos=3m En=18n Enk=100 In=0.01p Ink=10 Rin=1T  ; pins In+ In- V+ V- OUT
R5 N004 N003 22k
R6 Distance_Error N004 {RVal1}
.ends sensor_interface_sharpir

.tran 0 1m 0 1u startup
.param Speed_control=50k
.param Pre_multiplier=22k
.param Kd = 10k
.param Ki = 10k
.param Kp = 10k
.param Post_multiplier = 22k
.lib UniversalOpAmp2.lib
.backanno
.end